# EAGLE schematic RPI_Sensorstation_v1 (EAGLE 9.7.0)
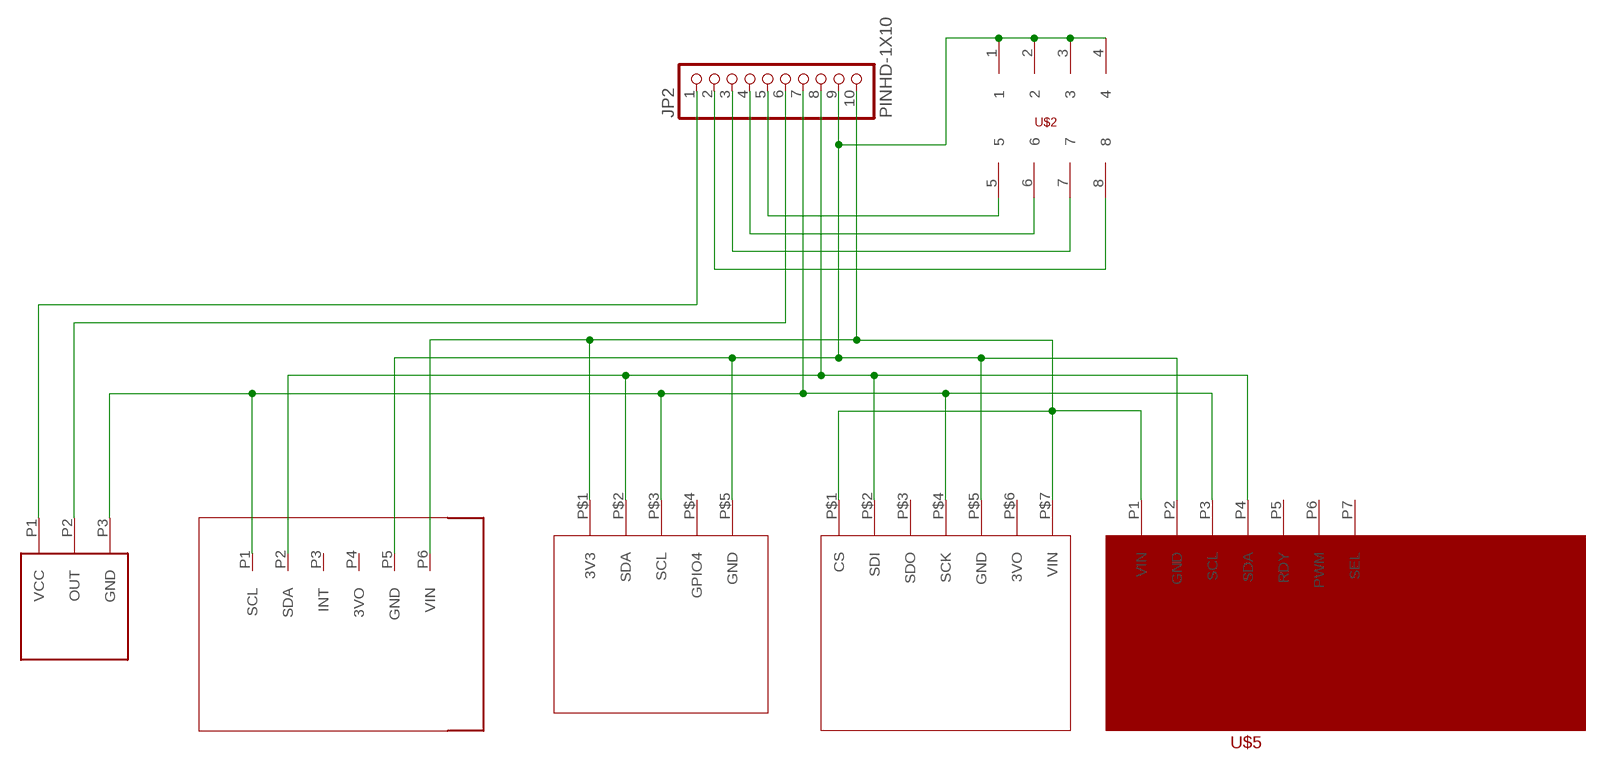
[diagram p0: schematic, sheet 1]

## Parts
BME280  BME280  [BME280]
JP2  PINHD-1X10  [1X10]
U$2  DIP_SWITCH  [DIP_SWITCH]
U$3  DS3231  [DS3231]
U$4  PIR_SENSOR  [PIR_SENSOR]
U$5  SCD30  [SCD30]
U$6  TSL2591  [TSL2591]

## Nets
5VOLTS: BME280.P$1(CS) BME280.P$7(VIN) JP2.10 U$3.P$1(3V3) U$5.P1(VIN) U$6.P6(VIN)
N$1: BME280.P$5(GND) JP2.9 U$2.1 U$2.2 U$2.3 U$2.4 U$3.P$5(GND) U$5.P2(GND) U$6.P5(GND)
N$2: BME280.P$2(SDI) JP2.8 U$3.P$2(SDA) U$5.P4(SDA) U$6.P2(SDA)
N$3: BME280.P$4(SCK) JP2.7 U$3.P$3(SCL) U$4.P3(GND) U$5.P3(SCL) U$6.P1(SCL)
N$4: JP2.6 U$4.P2(OUT)
N$5: JP2.1 U$4.P1(VCC)
N$6: JP2.5 U$2.5
N$7: JP2.4 U$2.6
N$8: JP2.3 U$2.7
N$9: JP2.2 U$2.8
Unconnected: BME280.P$3(SDO) BME280.P$6(3VO) U$3.P$4(GPIO4) U$5.P5(RDY) U$5.P6(PWM) U$5.P7(SEL) U$6.P3(INT) U$6.P4(3VO)

## Library data of the parts
BME280 = Maxis:BME280
JP2 = Connector:PINHD-1X10: PIN HEADER; CATEGORY: CONNECTOR; SUB-CATEGORY: PIN-HEADER
U$2 = Maxis:DIP_SWITCH
U$3 = Maxis:DS3231
U$4 = Maxis:PIR_SENSOR
U$5 = Maxis:SCD30
U$6 = Maxis:TSL2591